# Altium project Diff_Pair.PrjPcb
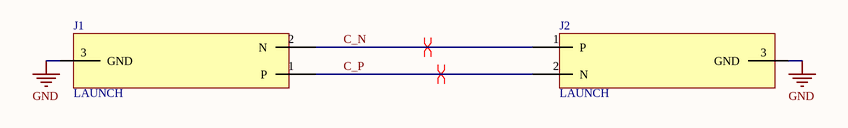
[diagram p0: Diff_Pair.SchDoc]
1 sheet, 2 parts. Net scope: global (net labels, ports and power ports of the same name join across sheets).
Board file: Diff_Pair.PcbDoc

## Sheet Diff_Pair.SchDoc
size A4; SheetNumber: 1; SheetTotal: 1

### Parts
J1  LAUNCH  [LAUNCH_FP]
J2  LAUNCH  [LAUNCH_FP]

### Nets
GND: J1.3(GND) J2.3(GND)
C_N: J1.2(N) J2.1(P)
C_P: J1.1(P) J2.2(N)

### Layout directives
differential pair: C_N, C_P